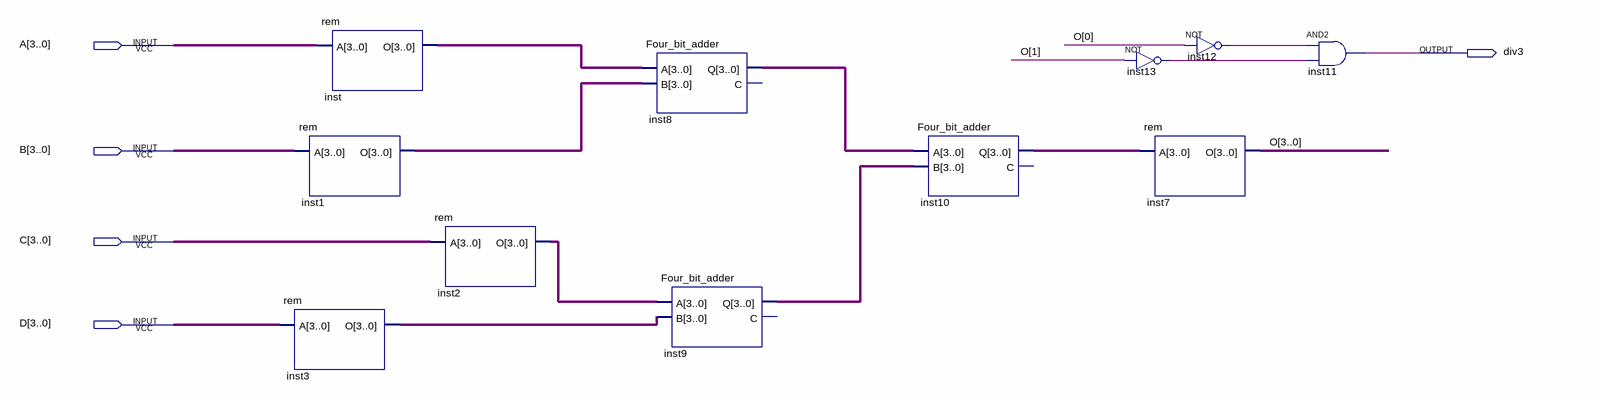
[diagram p0: schematic sheet]
// Quartus schematic Div3.bdf as structural Verilog: 11 symbols, 5 pins
module Div3 (
  input  [3:0] A,
  input  [3:0] B,
  input  [3:0] C,
  input  [3:0] D,
  output div3
);

  wire inst12_out, inst13_out;
  wire [3:0] inst1_o, inst2_o, inst3_o, inst8_q, inst9_q, inst10_q, inst_o, O;

  rem inst (.A(A), .O(inst_o));
  rem inst1 (.A(B), .O(inst1_o));
  rem inst3 (.A(D), .O(inst3_o));
  rem inst2 (.A(C), .O(inst2_o));
  Four_bit_adder inst8 (.A(inst_o), .B(inst1_o), .Q(inst8_q));  // open: C
  Four_bit_adder inst9 (.A(inst2_o), .B(inst3_o), .Q(inst9_q));  // open: C
  Four_bit_adder inst10 (.A(inst8_q), .B(inst9_q), .Q(inst10_q));  // open: C
  not inst13 (inst13_out, O[1]);
  rem inst7 (.A(inst10_q), .O(O));
  not inst12 (inst12_out, O[0]);
  and inst11 (div3, inst12_out, inst13_out);
endmodule
